# Altium schematic sheet resistive.SchDoc: Resistive Knob
size 290 x 209 mm; Author: chs; SheetNumber: 1; SheetTotal: 1
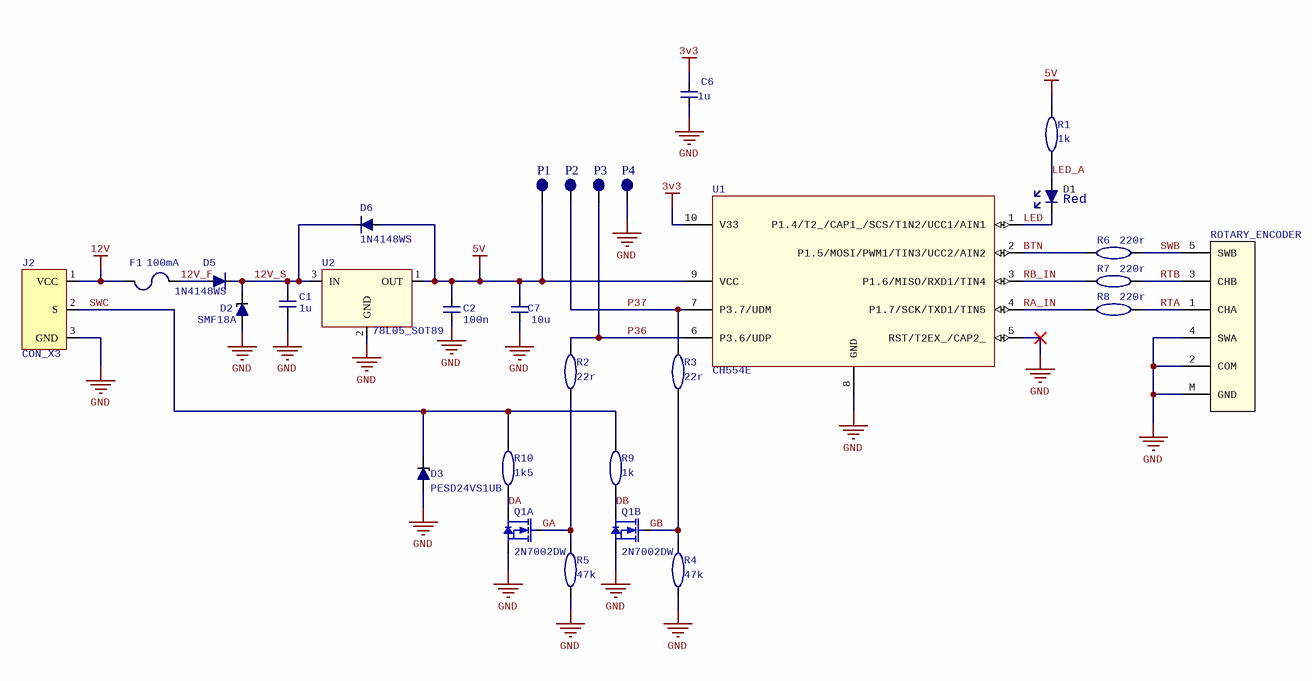
[diagram p0: resistive.SchDoc]

## Parts
C1  1u  [MLCC_0603]
C2  100n  [MLCC_0603]
C6  1u  [MLCC_0603]
C7  10u  [MLCC_0603]
D1  Red  [LED0603]
D2  SMF18A  [SOD-123FL]
D3  PESD24VS1UB  [SOD-523]
D5  1N4148WS  [SOD-323]
D6  1N4148WS  [SOD-323]
F1  100mA  [F1206]
J2  CON_X3  [CON_X3]  (no BOM)
P1  PAD  [PAD]  (value not drawn)  (no BOM)
P2  PAD  [PAD]  (value not drawn)  (no BOM)
P3  PAD  [PAD]  (value not drawn)  (no BOM)
P4  PAD  [PAD]  (value not drawn)  (no BOM)
Q1  2N7002DW  [SOT-363]  (parts A,B of 2)
R1  1k  [R0402]
R2  22r  [R0402]
R3  22r  [R0402]
R4  47k  [R0402]
R5  47k  [R0402]
R6  220r  [R0402]
R7  220r  [R0402]
R8  220r  [R0402]
R9  1k  [R0402]
R10  1k5  [R0402]
ROTARY_ENCODER  ROTARY_ENCODER  [ENCODER]  (value not drawn)
U1  CH554E  [MSOP10]
U2  78L05_SOT89  [SOT-89-3]

## Nets
3v3: C6.2(B) U1.10(V33)
5V: C2.2(B) C7.2(B) D6.A P1.1(PAD) R1.1(A) U1.9(VCC) U2.1(OUT)
12V: F1.2 J2.1(VCC)
GND: C1.1(A) C2.1(A) C6.1(A) C7.1(A) D2.A D3.A J2.3(GND) P4.1(PAD) Q1.1(S) Q1.4(S) R4.1(A) R5.1(A) ROTARY_ENCODER.2(COM) ROTARY_ENCODER.4(SWA) ROTARY_ENCODER.M(GND) U1.5(RST/T2EX_/CAP2_) U1.8(GND) U2.2(GND)
12V_F: D5.A F1.1
12V_S: C1.2(B) D2.K D5.K D6.K U2.3(IN)
BTN: R6.2(B) U1.2(P1.5/MOSI/PWM1/TIN3/UCC2/AIN2)
DA: Q1.6(D) R10.2(B)
DB: Q1.3(D) R9.2(B)
GA: Q1.2(G) R2.1(A) R5.2(B)
GB: Q1.5(G) R3.1(A) R4.2(B)
LED: D1.K(CATHODE) U1.1(P1.4/T2_/CAP1_/SCS/T1N2/UCC1/AIN1)
LED_A: D1.A(ANODE) R1.2(B)
P36: P3.1(PAD) R2.2(B) U1.6(P3.6/UDP)
P37: P2.1(PAD) R3.2(B) U1.7(P3.7/UDM)
RA_IN: R8.2(B) U1.4(P1.7/SCK/TXD1/TIN5)
RB_IN: R7.2(B) U1.3(P1.6/MISO/RXD1/TIN4)
RTA: R8.1(A) ROTARY_ENCODER.1(CHA)
RTB: R7.1(A) ROTARY_ENCODER.3(CHB)
SWB: R6.1(A) ROTARY_ENCODER.5(SWB)
SWC: D3.K J2.2(S) R9.1(A) R10.1(A)

## Library data of the parts
C1 C6 = CAP_0603_1U_50V: MLCC; Value: 1u; JLCPCB: C15849
C2 = CAP_0603_100N_50V: MLCC; Value: 100n; JLCPCB: C14663
C7 = CAP_0603_10U_10V: MLCC; Value: 10u; JLCPCB: C19702
D1 = LED_0603_RED: LED; Value: Red; JLCPCB: C2286
D2 = SMF18A: TVS Diode; JLCPCB: C19077512; Value: SMF18A
D3 = PESD24VS1UB: TVS Diode; JLCPCB: C85382; Value: PESD24VS1UB
D5 D6 = 1N4148WS: Silicon Diode; JLCPCB: C2128; Value: 1N4148WS
F1 = PTC_1206_100MA: FUSE; Part: nSMD010; Value: 100mA; JLCPCB: C70065
Q1 = 2N7002DW: Dual N-Channel MOSFET; Value: 2N7002DW; Part: 2N7002DW; JLCPCB: C5190214
R1 R9 = RES_0402_1K: Resistor; Value: 1k; JLCPCB: C11702
R2 R3 = RES_0402_22R: Resistor; Value: 22r; JLCPCB: C25092
R4 R5 = RES_0402_47K: Resistor; Value: 47k; JLCPCB: C25792
R6-R8 = RES_0402_220R: Resistor; Value: 220r; JLCPCB: C25091
R10 = RES_0402_1K5: Resistor; Value: 1k5; JLCPCB: C25867
ROTARY_ENCODER = ROTARY_ENCODER: Rotary Encoder
U2 = 78L05_SOT89: 5V LDO; Part: AS78L05RTR-E1; JLCPCB: C20628877
U1 = CH554E: JLCPCB: C111293